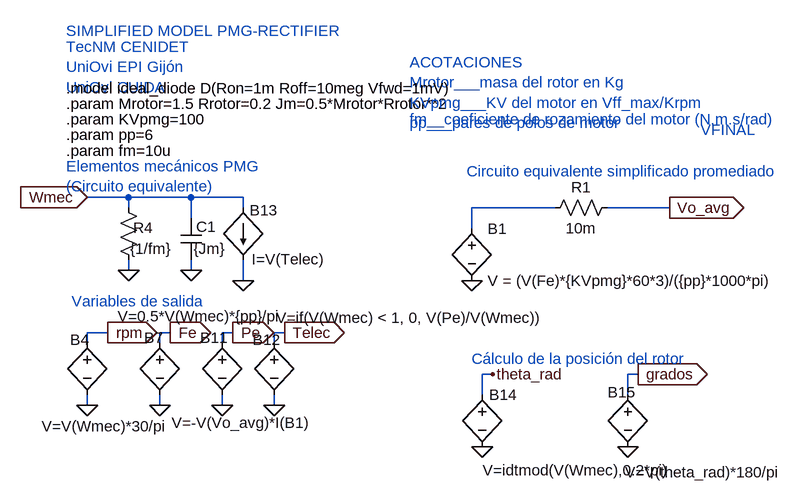
[diagram p0: schematic pmg_con_rect_simple.asc]
pmg_con_rect_simple.asc, the LTspice schematic file:
Version 4.1
SHEET 1 1092 1236
WIRE -816 464 -880 464
WIRE -720 464 -816 464
WIRE -640 464 -720 464
WIRE -816 480 -816 464
WIRE -640 480 -640 464
WIRE -160 480 -288 480
WIRE 16 480 -80 480
WIRE -720 496 -720 464
WIRE -288 512 -288 480
WIRE -816 576 -816 560
WIRE -720 576 -720 560
WIRE -640 592 -640 560
WIRE -848 672 -880 672
WIRE -752 672 -768 672
WIRE -656 672 -672 672
WIRE -576 672 -592 672
WIRE -880 688 -880 672
WIRE -768 688 -768 672
WIRE -672 688 -672 672
WIRE -592 688 -592 672
WIRE -256 736 -272 736
WIRE -32 736 -48 736
WIRE -272 768 -272 736
WIRE -48 768 -48 736
WIRE -880 784 -880 768
WIRE -768 784 -768 768
WIRE -672 784 -672 768
WIRE -592 784 -592 768
FLAG -880 464 Wmec
IOPIN -880 464 In
FLAG -720 576 0
FLAG -880 784 0
FLAG -848 672 rpm
IOPIN -848 672 Out
FLAG -768 784 0
FLAG -752 672 Fe
IOPIN -752 672 Out
FLAG -672 784 0
FLAG -656 672 Pe
IOPIN -656 672 Out
FLAG -592 784 0
FLAG -576 672 Telec
IOPIN -576 672 Out
FLAG -640 592 0
FLAG -816 576 0
FLAG -272 848 0
FLAG -256 736 theta_rad
FLAG -48 848 0
FLAG -32 736 grados
IOPIN -32 736 Out
FLAG 16 480 Vo_avg
IOPIN 16 480 Out
FLAG -288 592 0
SYMBOL cap -736 496 R0
WINDOW 0 24 13 Left 2
WINDOW 3 20 47 Left 2
SYMATTR InstName C1
SYMATTR Value {Jm}
SYMBOL bv -880 672 R0
WINDOW 3 -70 144 Left 2
WINDOW 0 -26 11 Left 2
SYMATTR Value V=V(Wmec)*30/pi
SYMATTR InstName B4
SYMBOL bv -768 672 R0
WINDOW 3 -65 -25 Left 2
WINDOW 0 -24 8 Left 2
SYMATTR Value V=0.5*V(Wmec)*{pp}/pi
SYMATTR InstName B7
SYMBOL bv -672 672 R0
WINDOW 3 -78 139 Left 2
WINDOW 0 -34 8 Left 2
SYMATTR Value V=-V(Vo_avg)*I(B1)
SYMATTR InstName B11
SYMBOL bv -592 672 R0
WINDOW 3 3 -23 Left 2
WINDOW 0 -33 11 Left 2
SYMATTR Value V=if(V(Wmec) < 1, 0, V(Pe)/V(Wmec))
SYMATTR InstName B12
SYMBOL bi -640 480 R0
WINDOW 0 10 4 Left 2
WINDOW 3 13 79 Left 2
SYMATTR InstName B13
SYMATTR Value I=V(Telec)
SYMBOL res -832 464 R0
WINDOW 0 23 47 Left 2
WINDOW 3 18 79 Left 2
SYMATTR InstName R4
SYMATTR Value {1/fm}
SYMBOL bv -272 752 R0
WINDOW 0 11 16 Left 2
WINDOW 3 1 132 Left 2
SYMATTR InstName B14
SYMATTR Value V=idtmod(V(Wmec),0.2*pi)
SYMBOL bv -48 752 R0
WINDOW 0 -31 12 Left 2
WINDOW 3 -4 135 Left 2
SYMATTR InstName B15
SYMATTR Value V=V(theta_rad)*180/pi
SYMBOL bv -288 496 R0
SYMATTR InstName B1
SYMATTR Value V = (V(Fe)*{KVpmg}*60*3)/({pp}*1000*pi)
SYMBOL res -64 464 R90
WINDOW 0 0 56 VBottom 2
WINDOW 3 32 56 VTop 2
SYMATTR InstName R1
SYMATTR Value 10m
TEXT -912 320 Left 2 !.param Mrotor=1.5 Rrotor=0.2 Jm=0.5*Mrotor*Rrotor**2
TEXT -912 344 Left 2 !.param KVpmg=100
TEXT -912 368 Left 2 !.param pp=6
TEXT -912 208 Left 2 ;SIMPLIFIED MODEL PMG-RECTIFIER
TEXT -384 256 Left 2 ;ACOTACIONES\nMrotor___masa del rotor en Kg\nKVpmg___KV del motor en Vff_max/Krpm\npp___pares de polos de motor
TEXT -288 712 Left 2 ;Cálculo de la posición del rotor
TEXT -904 624 Left 2 ;Variables de salida
TEXT -384 344 Left 2 ;fm__coeficiente de rozamiento del motor (N.m.s/rad)
TEXT -912 392 Left 2 !.param fm=10u
TEXT -912 416 Left 2 ;Elementos mecánicos PMG\n(Circuito equivalente)
TEXT -296 424 Left 2 ;Circuito equivalente simplificado promediado
TEXT -912 232 Left 2 ;TecNM CENIDET \nUniOvi EPI Gijón\nUniOvi CUIDA
TEXT -912 296 Left 2 !.model ideal_diode D(Ron=1m Roff=10meg Vfwd=1mV)
TEXT 64 360 Left 2 ;VFINAL

The netlist it stands for:
* pmg_con_rect_simple.asc
C1 Wmec 0 {Jm}
B4 rpm 0 V=V(Wmec)*30/pi
B7 Fe 0 V=0.5*V(Wmec)*{pp}/pi
B11 Pe 0 V=-V(Vo_avg)*I(B1)
B12 Telec 0 V=if(V(Wmec) < 1, 0, V(Pe)/V(Wmec))
B13 Wmec 0 I=V(Telec)
R4 Wmec 0 {1/fm}
B14 theta_rad 0 V=idtmod(V(Wmec),0.2*pi)
B15 grados 0 V=V(theta_rad)*180/pi
B1 N001 0 V = (V(Fe)*{KVpmg}*60*3)/({pp}*1000*pi)
R1 Vo_avg N001 10m
.param Mrotor=1.5 Rrotor=0.2 Jm=0.5*Mrotor*Rrotor**2
.param KVpmg=100
.param pp=6
* SIMPLIFIED MODEL PMG-RECTIFIER
* ACOTACIONES
* Mrotor___masa del rotor en Kg
* KVpmg___KV del motor en Vff_max/Krpm
* pp___pares de polos de motor
* Cálculo de la posición del rotor
* Variables de salida
* fm__coeficiente de rozamiento del motor (N.m.s/rad)
.param fm=10u
* Elementos mecánicos PMG
* (Circuito equivalente)
* Circuito equivalente simplificado promediado
* TecNM CENIDET
* UniOvi EPI Gijón
* UniOvi CUIDA
.model ideal_diode D(Ron=1m Roff=10meg Vfwd=1mV)
* VFINAL
.backanno
.end